# EasyEDA Pro project ProPrj_CraftVia-Core-S-RP235xA-v1-Rev0_2026-11-04.epro, schematic Schematic1
Board Name: Board1; Create Date: 2026-10-27; Page Name: P1; Project Name: CraftVia-Core-S-v1-Mechanical-Template; Schematic Name: Schematic1; Update Date: 2026-10-27; Company: CraftVia.org; Page Size: A4; Version: V1.0
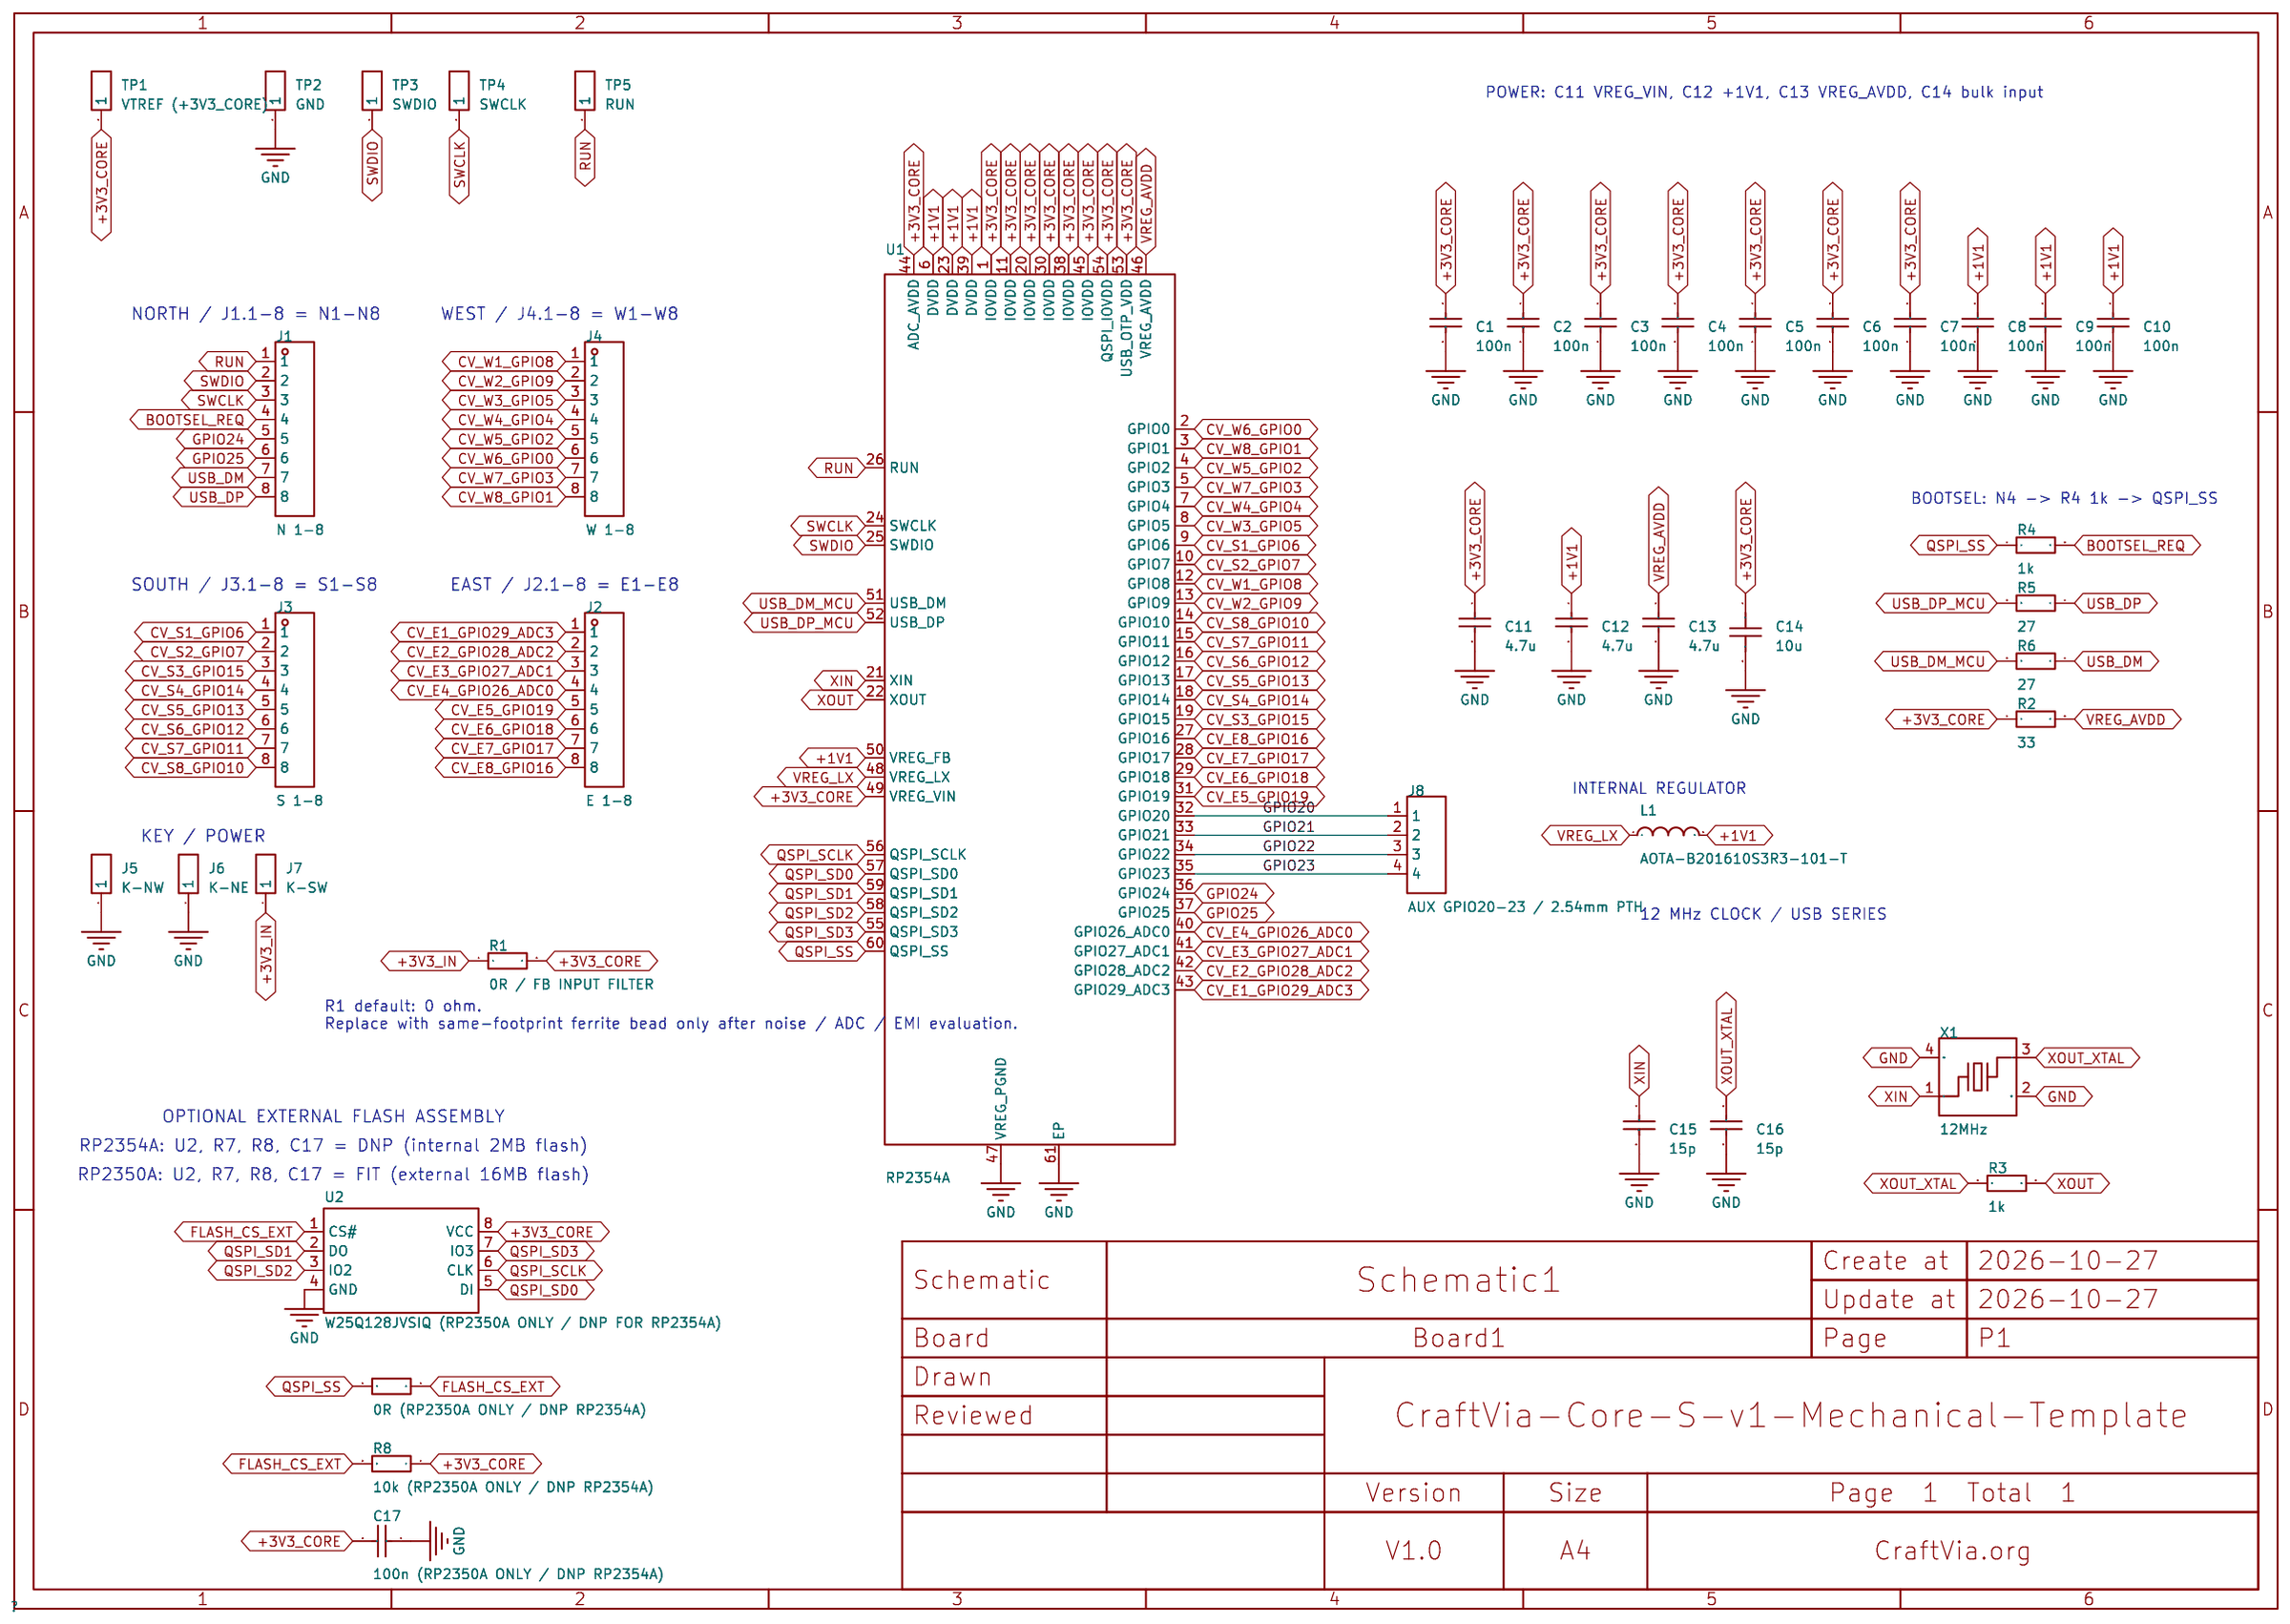
[diagram p1: schematic sheet]

## Parts
C1  100n  [C0402]
C2  100n  [C0402]
C3  100n  [C0402]
C4  100n  [C0402]
C5  100n  [C0402]
C6  100n  [C0402]
C7  100n  [C0402]
C8  100n  [C0402]
C9  100n  [C0402]
C10  100n  [C0402]
C11  4.7u  [C0402]
C12  4.7u  [C0402]
C13  4.7u  [C0402]
C14  10u  [C0805]
C15  15p  [C0402]
C16  15p  [C0402]
C17  100nF  [C0402]
J1  N 1-8  [HDR-TH_8P-P2.54-V-M]
J2  E 1-8  [HDR-TH_8P-P2.54-V-M]
J3  S 1-8  [HDR-TH_8P-P2.54-V-M]
J4  W 1-8  [HDR-TH_8P-P2.54-V-M]
J5  K-NW  [CraftVia-Core-S-KEY-TH_1P-P2.54-D1.00-P1.80]
J6  K-NE  [CraftVia-Core-S-KEY-TH_1P-P2.54-D1.00-P1.80]
J7  K-SW  [CraftVia-Core-S-KEY-TH_1P-P2.54-D1.00-P1.80]
J8  AUX GPIO20-23 / 2.54mm PTH  [HDR-TH_HDR-M_2.54_1X4P]
L1  3.3uH  [IND-SMD_L2.0-W1.6_AOTA-B201610S3R3-101-T]
R1  0R  [R0603]
R2  33  [R0402]
R3  1k  [R0402]
R4  1k  [R0402]
R5  27  [R0402]
R6  27  [R0402]
R7  0Ω  [R0402]
R8  10kΩ  [R0402]
TP1  VTREF (+3V3_CORE)  [HDR-TH_1P-P2.54-V-M]  (no BOM)
TP2  GND  [HDR-TH_1P-P2.54-V-M]  (no BOM)
TP3  SWDIO  [HDR-TH_1P-P2.54-V-M]  (no BOM)
TP4  SWCLK  [HDR-TH_1P-P2.54-V-M]  (no BOM)
TP5  RUN  [HDR-TH_1P-P2.54-V-M]  (no BOM)
U1  RP2354A  [QFN-60_L7.0-W7.0-P0.40-TL-EP3.4]
U2  W25Q128JVSIQ (RP2350A ONLY / DNP FOR RP2354A)  [SOIC-8_L5.3-W5.3-P1.27-LS8.0-BL]
X1  12MHz  [CRYSTAL-SMD_4P-L3.2-W2.5-BL]

## Library data of the parts
C1-C10 = GRM155R71E104KE14D: Capacitance:100nF Tolerance:±10% Tolerance:±10% Voltage Rating:25V Temperature Coefficient:X7R; LCSC Part Name: 100nF ±10% 25V; Supplier Part: C77014; Manufacturer: muRata(村田); Supplier Footprint: 0402; JLCPCB Part Class: Extended Part; Datasheet: https://item.szlcsc.com/datasheet/GRM155R71E104KE14D/78141.html; Supplier: LCSC; Tolerance: ±10%; Voltage Rating: 25V; Temperature Coefficient: X7R
C11-C13 = GRM155R60J475ME47D: Capacitance:4.7uF Tolerance:±20% Tolerance:±20% Voltage Rating:6.3V Temperature Coefficient:X5R; LCSC Part Name: 4.7uF ±20% 6.3V; Supplier Part: C82453; Manufacturer: muRata(村田); Supplier Footprint: 0402; JLCPCB Part Class: Extended Part; Datasheet: https://item.szlcsc.com/datasheet/GRM155R60J475ME47D/83610.html; Supplier: LCSC; Tolerance: ±20%; Voltage Rating: 6.3V; Temperature Coefficient: X5R
C14 = GRM21BR61C106KE15L: Capacitance: Tolerance:±10% Tolerance:±10% Voltage Rated: Temperature Coefficient:; LCSC Part Name: 10uF ±10% 16V; Supplier Part: C77075; Manufacturer: muRata(村田); Supplier Footprint: 0805; JLCPCB Part Class: Extended Part; Datasheet: https://atta.szlcsc.com/upload/public/pdf/source/20200305/C490387_23319AE8C154DEB24C505E6C82A8106A.pdf; Supplier: LCSC; Tolerance: ±10%
C15 C16 = GRM1555C1H150JA01D: Capacitance:15pF Tolerance:±5% Tolerance:±5% Voltage Rating:50V Temperature Coefficient:C0G; LCSC Part Name: 15pF ±5% 50V; Supplier Part: C76950; Manufacturer: muRata(村田); Supplier Footprint: 0402; JLCPCB Part Class: Extended Part; Datasheet: https://item.szlcsc.com/datasheet/GRM1555C1H150JA01D/78077.html; Supplier: LCSC; Tolerance: ±5%; Voltage Rating: 50V; Temperature Coefficient: C0G
C17 = GRM155R71E104KE14D: Capacitance:100nF Tolerance:±10% Tolerance:±10% Voltage Rating:25V Temperature Coefficient:X7R; LCSC Part Name: 100nF ±10% 25V; Supplier Part: C77014; Manufacturer: muRata(村田); Supplier Footprint: 0402; JLCPCB Part Class: Extended Part; Datasheet: https://item.szlcsc.com/datasheet/GRM155R71E104KE14D/78141.html; Supplier: LCSC; Tolerance: ±10%; Voltage Rating: 25V; Temperature Coefficient: X7R; DNP: RP2354A; Assembly Variant: RP2350A=FIT; RP2354A=DNP; Populate Variant: RP2350A; DNP Variant: RP2354A
J1-J4 = 直排针2.54mm 1*8P: Circluar Pins/Square Pins:- Current Rating (Max):- Voltage Rating (Max):- Length of Mating Pin:- Insulation Height:- Contact Material:; LCSC Part Name: 直排针 2.54mm 1*8P; Supplier Part: Header2.54mm 1*8P.1; Supplier Footprint: 插件; JLCPCB Part Class: Extended Part; Supplier: LCSC
J5-J7 TP2-TP5 = 2.54-1*1P针: Pin Structure:1x1P Pitch:- Row Spacing:- Circluar Pins/Square Pins:Pin Header Mounting Type:Through Hole Number of Rows:1 Number of Pins:1P Current Rating:3A Voltage Rating (Max):- Length of Mating Pin:6mm Insulation Height:2.5mm Length of End Connection; LCSC Part Name: 1x1P 方针 直插; Supplier Part: Header-Male-2.54_1x1.1; Manufacturer: BOOMELE(博穆精密); Supplier Footprint: 插件,P=2.54mm; JLCPCB Part Class: Extended Part; Datasheet: https://item.szlcsc.com/datasheet/2.54-1*1P%25E9%2592%2588/82426.html; Supplier: LCSC; Pin Structure: 1x1P; Circluar Pins/Square Pins: Pin Header; Mounting Type: Through Hole; Number of Rows: 1; Number of Pins: 1P; Current Rating: 3A; Length of Mating Pin: 6mm; Insulation Height: 2.5mm; Length of End Connection Pin: 3mm; Contact Material: Brass; Contact Plating: Gold; Operating Temperature: -55℃~+105℃; Color: Black
J8 = HDR-M_2.54_1x4P_C9900236824: LCSC Part Name: HDR-M_2.54_1x4P; Supplier Part: C9900236824; Manufacturer Part: HDR-M_2.54_1x4P; Supplier Footprint: HDR-TH_4P-P2.54-V-M; JLCPCB Part Class: Extended Part; Supplier: LCSC
L1 = AOTA-B201610S3R3-101-T: LCSC Part Name: 3.3uH 2.4A; Supplier Part: C42411119; Manufacturer: ABRACON; Supplier Footprint: 0806; JLCPCB Part Class: Extended Part; Datasheet: https://item.szlcsc.com/datasheet/AOTA-B201610S3R3-101-T/44392932.html; Supplier: LCSC
R1 = 0603WAF0000T5E: Default 0 ohm. Replace with same-footprint ferrite bead only after noise/ADC/EMI evaluation.; LCSC Part Name: 厚膜电阻 0Ω ±1%; Supplier Part: 0603WAF0000T5E.1; Manufacturer: UNI-ROYAL(厚声); Supplier Footprint: 0603; JLCPCB Part Class: Basic Part; Datasheet: https://item.szlcsc.com/datasheet/0603WAF0000T5E/21903.html; Supplier: LCSC; Type: Thick Film Resistor; Tolerance: ±1%; Power(Watts): 100mW; Voltage-Supply(Max): 75V; Operating Temperature: -55℃~+155℃; DNP: No
R2 = RC0402FR-0733RL: Type:Thick Film Resistor Resistance:33Ω Tolerance:±1% Tolerance:±1% Power(Watts):62.5mW Voltage-Supply(Max):50V Temperature Coefficient:±100ppm/℃ Temperature Coefficient:±100ppm/℃ Operating Temperature:-55℃~+155℃ Operating Temperature:-55℃~+155℃; LCSC Part Name: 厚膜电阻 33Ω ±1% 62.5mW; Supplier Part: C138002; Manufacturer: YAGEO(国巨); Supplier Footprint: 0402; JLCPCB Part Class: Extended Part; Datasheet: https://item.szlcsc.com/datasheet/RC0402FR-0733RL/149318.html; Supplier: LCSC; Type: Thick Film Resistor; Tolerance: ±1%; Power(Watts): 62.5mW; Voltage-Supply(Max): 50V; Temperature Coefficient: ±100ppm/℃; Operating Temperature: -55℃~+155℃
R3 R4 = RC0402FR-071KL: Type:Thick Film Resistor Resistance:1kΩ Tolerance:±1% Tolerance:±1% Power(Watts):62.5mW Voltage-Supply(Max):50V Temperature Coefficient:±100ppm/℃ Temperature Coefficient:±100ppm/℃ Operating Temperature:-55℃~+155℃ Operating Temperature:-55℃~+155℃; LCSC Part Name: 厚膜电阻 1kΩ ±1% 62.5mW; Supplier Part: C106235; Manufacturer: YAGEO(国巨); Supplier Footprint: 0402; JLCPCB Part Class: Extended Part; Datasheet: https://item.szlcsc.com/datasheet/RC0402FR-071KL/107450.html; Supplier: LCSC; Type: Thick Film Resistor; Tolerance: ±1%; Power(Watts): 62.5mW; Voltage-Supply(Max): 50V; Temperature Coefficient: ±100ppm/℃; Operating Temperature: -55℃~+155℃
R5 R6 = RC0402FR-0727RL: Type:Thick Film Resistor Resistance:27Ω Tolerance:±1% Tolerance:±1% Power(Watts):62.5mW Voltage-Supply(Max):50V Temperature Coefficient:±100ppm/℃ Temperature Coefficient:±100ppm/℃ Operating Temperature:-55℃~+155℃ Operating Temperature:-55℃~+155℃; LCSC Part Name: 厚膜电阻 27Ω ±1% 62.5mW; Supplier Part: C138021; Manufacturer: YAGEO(国巨); Supplier Footprint: 0402; JLCPCB Part Class: Extended Part; Datasheet: https://item.szlcsc.com/datasheet/RC0402FR-0727RL/149337.html; Supplier: LCSC; Type: Thick Film Resistor; Tolerance: ±1%; Power(Watts): 62.5mW; Voltage-Supply(Max): 50V; Temperature Coefficient: ±100ppm/℃; Operating Temperature: -55℃~+155℃
R7 = RC0402JR-070RL: Type:Thick Film Resistor Resistance:0Ω Tolerance:±5% Tolerance:±5% Power(Watts):62.5mW Voltage-Supply(Max):50V Temperature Coefficient:- Temperature Coefficient:- Operating Temperature:-55℃~+155℃ Operating Temperature:-55℃~+155℃; LCSC Part Name: 厚膜电阻 0Ω ±5% 62.5mW; Supplier Part: C60485; Manufacturer: YAGEO(国巨); Supplier Footprint: 0402; JLCPCB Part Class: Extended Part; Datasheet: https://item.szlcsc.com/datasheet/RC0402JR-070RL/61537.html; Supplier: LCSC; Type: Thick Film Resistor; Tolerance: ±5%; Power(Watts): 62.5mW; Voltage-Supply(Max): 50V; Operating Temperature: -55℃~+155℃; DNP: RP2354A; Assembly Variant: RP2350A=FIT; RP2354A=DNP; Populate Variant: RP2350A; DNP Variant: RP2354A
R8 = RC0402FR-0710KL: Type:Thick Film Resistor Resistance:10kΩ Tolerance:±1% Tolerance:±1% Power(Watts):62.5mW Voltage-Supply(Max):50V Temperature Coefficient:±100ppm/℃ Temperature Coefficient:±100ppm/℃ Operating Temperature:-55℃~+155℃ Operating Temperature:-55℃~+155℃; LCSC Part Name: 厚膜电阻 10kΩ ±1% 62.5mW; Supplier Part: C60490; Manufacturer: YAGEO(国巨); Supplier Footprint: 0402; JLCPCB Part Class: Extended Part; Datasheet: https://item.szlcsc.com/datasheet/RC0402FR-0710KL/61542.html; Supplier: LCSC; Type: Thick Film Resistor; Tolerance: ±1%; Power(Watts): 62.5mW; Voltage-Supply(Max): 50V; Temperature Coefficient: ±100ppm/℃; Operating Temperature: -55℃~+155℃; DNP: RP2354A; Assembly Variant: RP2350A=FIT; RP2354A=DNP; Populate Variant: RP2350A; DNP Variant: RP2354A
TP1 = 2.54-1*1P针: Pin Structure:1x1P Pitch:- Row Spacing:- Circluar Pins/Square Pins:Pin Header Mounting Type:Through Hole Number of Rows:1 Number of Pins:1P Current Rating:3A Voltage Rating (Max):- Length of Mating Pin:6mm Insulation Height:2.5mm Length of End Connection; LCSC Part Name: 1x1P 方针 直插; Supplier Part: Header-Male-2.54_1x1.1; Manufacturer: BOOMELE(博穆精密); Supplier Footprint: 插件,P=2.54mm; JLCPCB Part Class: Extended Part; Datasheet: https://item.szlcsc.com/datasheet/2.54-1*1P%25E9%2592%2588/82426.html; Supplier: LCSC; Pin Structure: 1x1P; Circluar Pins/Square Pins: Pin Header; Mounting Type: Through Hole; Number of Rows: 1; Number of Pins: 1P; Current Rating: 3A; Length of Mating Pin: 6mm; Insulation Height: 2.5mm; Length of End Connection Pin: 3mm; Contact Material: Brass; Contact Plating: Gold; Operating Temperature: -55℃~+105℃; Color: Black; Net: +3V3_CORE
U1 = RP2354A: CPU Core:ARM Cortex-M33 CPU Maximum Speed:150MHz Core Size:32 Bit Oscillator Type:Built-in+External Features:Independent watchdog (IWDG)；Undervoltage detection (BOR/LVD/LVR/LVI)；Calendar function；Power-on reset (POR)；True random number generator (TRNG)；Wa; LCSC Part Name: SC1511(13)-A4; Supplier Part: C41378174; Manufacturer: Raspberry Pi(树莓派); Supplier Footprint: QFN-60(7x7); JLCPCB Part Class: Extended Part; Datasheet: https://item.szlcsc.com/datasheet/RP2354A/43147979.html; Supplier: LCSC; CPU Core: ARM Cortex-M33; CPU Maximum Speed: 150MHz; Core Size: 32 Bit; Oscillator Type: Built-in+External; Features: Independent watchdog (IWDG)；Undervoltage detection (BOR/LVD/LVR/LVI)；Calendar function；Power-on reset (POR)；True random number generator (TRNG)；Watchdog reset；Built-in general-purpose timer；Hardware ECC check；Integrated LDO; Supported MCU: RP2350A / RP2354A; Assembly Variant: RP2350A=RP2350A; RP2354A=RP2354A; Alternate Part (RP2350A): RP2350A; Populate Variant: RP2350A / RP2354A
U2 = W25Q128JVSIQ: Interface:SPI Memory Size:128Mbit Clock Frequency:133MHz Voltage - Supply:2.7V~3.6V Voltage - Supply:2.7V~3.6V Standby Supply Current:1uA Program / Erase Cycles:100,000 cycles Write Cycle Time (tWC):- Page Programming Time (Tpp):3ms Block Erase Time(tBE):; LCSC Part Name: 编带 支持双路/四路SPI接口的3V、128Mbit 串行闪存; Supplier Part: C97521; Manufacturer: Winbond(华邦); Supplier Footprint: SOIC-8-208mil; JLCPCB Part Class: Basic Part; Datasheet: https://item.szlcsc.com/datasheet/W25Q128JVSIQ/98729.html; Supplier: LCSC; Interface: SPI; Memory Size: 128Mbit; Clock Frequency: 133MHz; Voltage - Supply: 2.7V~3.6V; Standby Supply Current: 1uA; Program / Erase Cycles: 100,000 cycles; Page Programming Time (Tpp): 3ms; Block Erase Time(tBE): 120ms@(32KB); Data Retention - TDR (Year): 20 Years; Operating Temperature: -40℃~+85℃; Features: Hardware write protection；Absolute write protection；Write enable latch；Software write protection；Power-on reset; DNP: RP2354A; Assembly Variant: RP2350A=FIT; RP2354A=DNP; Populate Variant: RP2350A; DNP Variant: RP2354A
X1 = ABM8-272-T3_C20625731: Type:SMD crystal oscillator Frequency:12MHz Normal temperature Frequency Tolerance:±30ppm Normal temperature Frequency Tolerance:±30ppm Load Capacitance:10pF Frequency Stability:±30ppm Frequency Stability:±30ppm Equivalent Series Resistance(ESR):50Ω Opera; LCSC Part Name: 12MHz ±30ppm 10pF; Supplier Part: C20625731; Manufacturer: ABRACON; Manufacturer Part: ABM8-272-T3; Supplier Footprint: SMD3225-4P; JLCPCB Part Class: Extended Part; Datasheet: https://item.szlcsc.com/datasheet/ABM8-272-T3/22032038.html; Supplier: LCSC; Type: SMD crystal oscillator; Normal temperature Frequency Tolerance: ±30ppm; Load Capacitance: 10pF; Frequency Stability: ±30ppm; Equivalent Series Resistance(ESR): 50Ω; Operating Temperature: -40℃~+85℃

## Nets
+1V1: C8.1 C9.1 C10.1 C12.1 L1.2 U1.6(DVDD) U1.23(DVDD) U1.39(DVDD) U1.50(VREG_FB)
+3V3_CORE: C1.1 C2.1 C3.1 C4.1 C5.1 C6.1 C7.1 C11.1 C14.1 C17.2 R1.2 R2.1 R8.1 TP1.1 U1.1(IOVDD) U1.11(IOVDD) U1.20(IOVDD) U1.30(IOVDD) U1.38(IOVDD) U1.44(ADC_AVDD) U1.45(IOVDD) U1.49(VREG_VIN) U1.53(USB_OTP_VDD) U1.54(QSPI_IOVDD) U2.8(VCC)
+3V3_IN: J7.1 R1.1
GND: C1.2 C2.2 C3.2 C4.2 C5.2 C6.2 C7.2 C8.2 C9.2 C10.2 C11.2 C12.2 C13.2 C14.2 C15.2 C16.2 C17.1 J5.1 J6.1 TP2.1 U1.47(VREG_PGND) U1.61(EP) U2.4(GND) X1.2(GND) X1.4(GND)
BOOTSEL_REQ: J1.4 R4.2
CV_E1_GPIO29_ADC3: J2.1 U1.43(GPIO29_ADC3)
CV_E2_GPIO28_ADC2: J2.2 U1.42(GPIO28_ADC2)
CV_E3_GPIO27_ADC1: J2.3 U1.41(GPIO27_ADC1)
CV_E4_GPIO26_ADC0: J2.4 U1.40(GPIO26_ADC0)
CV_E5_GPIO19: J2.5 U1.31(GPIO19)
CV_E6_GPIO18: J2.6 U1.29(GPIO18)
CV_E7_GPIO17: J2.7 U1.28(GPIO17)
CV_E8_GPIO16: J2.8 U1.27(GPIO16)
CV_S1_GPIO6: J3.1 U1.9(GPIO6)
CV_S2_GPIO7: J3.2 U1.10(GPIO7)
CV_S3_GPIO15: J3.3 U1.19(GPIO15)
CV_S4_GPIO14: J3.4 U1.18(GPIO14)
CV_S5_GPIO13: J3.5 U1.17(GPIO13)
CV_S6_GPIO12: J3.6 U1.16(GPIO12)
CV_S7_GPIO11: J3.7 U1.15(GPIO11)
CV_S8_GPIO10: J3.8 U1.14(GPIO10)
CV_W1_GPIO8: J4.1 U1.12(GPIO8)
CV_W2_GPIO9: J4.2 U1.13(GPIO9)
CV_W3_GPIO5: J4.3 U1.8(GPIO5)
CV_W4_GPIO4: J4.4 U1.7(GPIO4)
CV_W5_GPIO2: J4.5 U1.4(GPIO2)
CV_W6_GPIO0: J4.6 U1.2(GPIO0)
CV_W7_GPIO3: J4.7 U1.5(GPIO3)
CV_W8_GPIO1: J4.8 U1.3(GPIO1)
FLASH_CS_EXT: R7.2 R8.2 U2.1(CS#)
GPIO20: J8.1 U1.32(GPIO20)
GPIO21: J8.2 U1.33(GPIO21)
GPIO22: J8.3 U1.34(GPIO22)
GPIO23: J8.4 U1.35(GPIO23)
GPIO24: J1.5 U1.36(GPIO24)
GPIO25: J1.6 U1.37(GPIO25)
QSPI_SCLK: U1.56(QSPI_SCLK) U2.6(CLK)
QSPI_SD0: U1.57(QSPI_SD0) U2.5(DI)
QSPI_SD1: U1.59(QSPI_SD1) U2.2(DO)
QSPI_SD2: U1.58(QSPI_SD2) U2.3(IO2)
QSPI_SD3: U1.55(QSPI_SD3) U2.7(IO3)
QSPI_SS: R4.1 R7.1 U1.60(QSPI_SS)
RUN: J1.1 TP5.1 U1.26(RUN)
SWCLK: J1.3 TP4.1 U1.24(SWCLK)
SWDIO: J1.2 TP3.1 U1.25(SWDIO)
USB_DM: J1.7 R6.1
USB_DM_MCU: R6.2 U1.51(USB_DM)
USB_DP: J1.8 R5.1
USB_DP_MCU: R5.2 U1.52(USB_DP)
VREG_AVDD: C13.1 R2.2 U1.46(VREG_AVDD)
VREG_LX: L1.1 U1.48(VREG_LX)
XIN: C15.1 U1.21(XIN) X1.1
XOUT: R3.2 U1.22(XOUT)
XOUT_XTAL: C16.1 R3.1 X1.3

## Notes on the sheet
- POWER: C11 VREG_VIN, C12 +1V1, C13 VREG_AVDD, C14 bulk input
- NORTH / J1.1-8 = N1-N8
- WEST / J4.1-8 = W1-W8
- BOOTSEL: N4 -> R4 1k -> QSPI_SS
- SOUTH / J3.1-8 = S1-S8
- EAST / J2.1-8 = E1-E8
- INTERNAL REGULATOR
- KEY / POWER
- 12 MHz CLOCK / USB SERIES
- R1 default: 0 ohm.
  Replace with same-footprint ferrite bead only after noise / ADC / EMI evaluation.
- OPTIONAL EXTERNAL FLASH ASSEMBLY
- RP2354A: U2, R7, R8, C17 = DNP (internal 2MB flash)
- RP2350A: U2, R7, R8, C17 = FIT (external 16MB flash)
